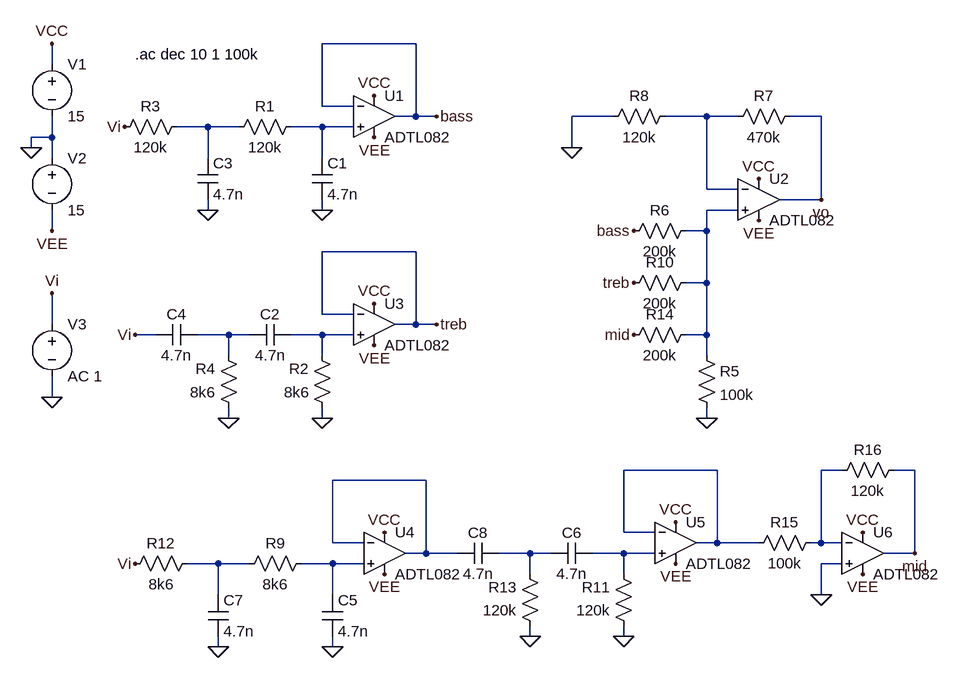
[diagram p0: schematic eq.asc]
eq.asc, the LTspice schematic file:
Version 4.1
SHEET 1 1384 1300
WIRE 448 32 304 32
WIRE -112 64 -112 32
WIRE 304 128 304 32
WIRE 352 128 304 128
WIRE 448 144 448 32
WIRE 448 144 416 144
WIRE 480 144 448 144
WIRE 752 144 688 144
WIRE 896 144 832 144
WIRE 944 144 896 144
WIRE 1072 144 1024 144
WIRE 128 160 80 160
WIRE 176 160 128 160
WIRE 304 160 256 160
WIRE 352 160 304 160
WIRE -112 176 -112 144
WIRE -112 176 -144 176
WIRE -144 192 -144 176
WIRE 688 192 688 144
WIRE -112 208 -112 176
WIRE 128 208 128 160
WIRE 304 208 304 160
WIRE 896 256 896 144
WIRE 944 256 896 256
WIRE 1072 272 1072 144
WIRE 1072 272 1008 272
WIRE 128 288 128 272
WIRE 304 288 304 272
WIRE 944 288 896 288
WIRE -112 320 -112 288
WIRE 896 320 896 288
WIRE 896 320 864 320
WIRE 448 352 304 352
WIRE 896 400 896 320
WIRE 896 400 864 400
WIRE 304 448 304 352
WIRE 352 448 304 448
WIRE -112 464 -112 416
WIRE 448 464 448 352
WIRE 448 464 416 464
WIRE 480 464 448 464
WIRE 48 480 16 480
WIRE 160 480 112 480
WIRE 192 480 160 480
WIRE 304 480 256 480
WIRE 352 480 304 480
WIRE 896 480 896 400
WIRE 896 480 864 480
WIRE 160 512 160 480
WIRE 304 512 304 480
WIRE 896 512 896 480
WIRE -112 576 -112 544
WIRE 160 608 160 592
WIRE 304 608 304 592
WIRE 896 608 896 592
WIRE 912 688 768 688
WIRE 1104 688 1072 688
WIRE 1216 688 1184 688
WIRE 464 704 320 704
WIRE 768 784 768 688
WIRE 816 784 768 784
WIRE 320 800 320 704
WIRE 368 800 320 800
WIRE 912 800 912 688
WIRE 912 800 880 800
WIRE 976 800 912 800
WIRE 1072 800 1072 688
WIRE 1072 800 1056 800
WIRE 1104 800 1072 800
WIRE 464 816 464 704
WIRE 464 816 432 816
WIRE 512 816 464 816
WIRE 624 816 576 816
WIRE 656 816 624 816
WIRE 768 816 720 816
WIRE 816 816 768 816
WIRE 1216 816 1216 688
WIRE 1216 816 1168 816
WIRE 144 832 96 832
WIRE 192 832 144 832
WIRE 320 832 272 832
WIRE 368 832 320 832
WIRE 1104 832 1072 832
WIRE 624 848 624 816
WIRE 768 848 768 816
WIRE 144 880 144 832
WIRE 320 880 320 832
WIRE 1072 880 1072 832
WIRE 624 944 624 928
WIRE 768 944 768 928
WIRE 144 960 144 944
WIRE 320 960 320 944
FLAG -112 320 VEE
FLAG 384 176 VEE
FLAG -112 32 VCC
FLAG 384 112 VCC
FLAG -144 192 0
FLAG -112 576 0
FLAG 480 144 bass
FLAG -112 416 Vi
FLAG 304 288 0
FLAG 0 160 Vi
FLAG 384 496 VEE
FLAG 384 432 VCC
FLAG 480 464 treb
FLAG 304 608 0
FLAG 16 480 Vi
FLAG 128 288 0
FLAG 160 608 0
FLAG 976 240 VCC
FLAG 976 304 VEE
FLAG 896 608 0
FLAG 784 320 bass
FLAG 784 400 treb
FLAG 1072 272 vo
FLAG 400 848 VEE
FLAG 400 784 VCC
FLAG 320 960 0
FLAG 16 832 Vi
FLAG 848 832 VEE
FLAG 848 768 VCC
FLAG 1216 816 mid
FLAG 768 944 0
FLAG 144 960 0
FLAG 624 944 0
FLAG 784 480 mid
FLAG 688 192 0
FLAG 1136 784 VCC
FLAG 1136 848 VEE
FLAG 1072 880 0
SYMBOL OpAmps\\ADTL082 384 80 R0
SYMATTR InstName U1
SYMBOL voltage -112 48 R0
WINDOW 123 0 0 Left 0
WINDOW 39 0 0 Left 0
SYMATTR InstName V1
SYMATTR Value 15
SYMBOL voltage -112 192 R0
WINDOW 123 0 0 Left 0
WINDOW 39 0 0 Left 0
SYMATTR InstName V2
SYMATTR Value 15
SYMBOL voltage -112 448 R0
WINDOW 123 0 0 Left 0
WINDOW 39 0 0 Left 0
SYMATTR InstName V3
SYMATTR Value AC 1
SYMBOL res 272 144 R90
WINDOW 0 0 56 VBottom 2
WINDOW 3 32 56 VTop 2
SYMATTR InstName R1
SYMATTR Value 120k
SYMBOL cap 288 208 R0
SYMATTR InstName C1
SYMATTR Value 4.7n
SYMBOL OpAmps\\ADTL082 384 400 R0
SYMATTR InstName U3
SYMBOL res 320 608 R180
WINDOW 0 36 76 Left 2
WINDOW 3 36 40 Left 2
SYMATTR InstName R2
SYMATTR Value 8k6
SYMBOL cap 256 464 R90
WINDOW 0 0 32 VBottom 2
WINDOW 3 32 32 VTop 2
SYMATTR InstName C2
SYMATTR Value 4.7n
SYMBOL res 96 144 R90
WINDOW 0 0 56 VBottom 2
WINDOW 3 32 56 VTop 2
SYMATTR InstName R3
SYMATTR Value 120k
SYMBOL cap 112 208 R0
SYMATTR InstName C3
SYMATTR Value 4.7n
SYMBOL res 176 608 R180
WINDOW 0 36 76 Left 2
WINDOW 3 36 40 Left 2
SYMATTR InstName R4
SYMATTR Value 8k6
SYMBOL cap 112 464 R90
WINDOW 0 0 32 VBottom 2
WINDOW 3 32 32 VTop 2
SYMATTR InstName C4
SYMATTR Value 4.7n
SYMBOL OpAmps\\ADTL082 976 208 R0
SYMATTR InstName U2
SYMBOL res 880 496 R0
SYMATTR InstName R5
SYMATTR Value 100k
SYMBOL res 880 304 R90
WINDOW 0 0 56 VBottom 2
WINDOW 3 32 56 VTop 2
SYMATTR InstName R6
SYMATTR Value 200k
SYMBOL res 880 384 R90
WINDOW 0 0 56 VBottom 2
WINDOW 3 32 56 VTop 2
SYMATTR InstName R10
SYMATTR Value 200k
SYMBOL OpAmps\\ADTL082 400 752 R0
SYMATTR InstName U4
SYMBOL res 288 816 R90
WINDOW 0 0 56 VBottom 2
WINDOW 3 32 56 VTop 2
SYMATTR InstName R9
SYMATTR Value 8k6
SYMBOL cap 304 880 R0
SYMATTR InstName C5
SYMATTR Value 4.7n
SYMBOL OpAmps\\ADTL082 848 736 R0
SYMATTR InstName U5
SYMBOL res 784 944 R180
WINDOW 0 36 76 Left 2
WINDOW 3 36 40 Left 2
SYMATTR InstName R11
SYMATTR Value 120k
SYMBOL cap 720 800 R90
WINDOW 0 0 32 VBottom 2
WINDOW 3 32 32 VTop 2
SYMATTR InstName C6
SYMATTR Value 4.7n
SYMBOL res 112 816 R90
WINDOW 0 0 56 VBottom 2
WINDOW 3 32 56 VTop 2
SYMATTR InstName R12
SYMATTR Value 8k6
SYMBOL cap 128 880 R0
SYMATTR InstName C7
SYMATTR Value 4.7n
SYMBOL res 640 944 R180
WINDOW 0 36 76 Left 2
WINDOW 3 36 40 Left 2
SYMATTR InstName R13
SYMATTR Value 120k
SYMBOL cap 576 800 R90
WINDOW 0 0 32 VBottom 2
WINDOW 3 32 32 VTop 2
SYMATTR InstName C8
SYMATTR Value 4.7n
SYMBOL res 880 464 R90
WINDOW 0 0 56 VBottom 2
WINDOW 3 32 56 VTop 2
SYMATTR InstName R14
SYMATTR Value 200k
SYMBOL res 1040 128 R90
WINDOW 0 0 56 VBottom 2
WINDOW 3 32 56 VTop 2
SYMATTR InstName R7
SYMATTR Value 470k
SYMBOL res 848 128 R90
WINDOW 0 0 56 VBottom 2
WINDOW 3 32 56 VTop 2
SYMATTR InstName R8
SYMATTR Value 120k
SYMBOL OpAmps\\ADTL082 1136 752 R0
SYMATTR InstName U6
SYMBOL res 1072 784 R90
WINDOW 0 0 56 VBottom 2
WINDOW 3 32 56 VTop 2
SYMATTR InstName R15
SYMATTR Value 100k
SYMBOL res 1200 672 R90
WINDOW 0 0 56 VBottom 2
WINDOW 3 32 56 VTop 2
SYMATTR InstName R16
SYMATTR Value 120k
TEXT 16 48 Left 2 !.ac dec 10 1 100k

The netlist it stands for:
* eq.asc
X§U1 N003 bass VCC VEE bass ADTL082  ; pins In+ In- V+ V- OUT
V1 VCC 0 15
V2 0 VEE 15
V3 Vi 0 AC 1
R1 N003 N002 120k
C1 N003 0 4.7n
X§U3 N006 treb VCC VEE treb ADTL082  ; pins In+ In- V+ V- OUT
R2 0 N006 8k6
C2 N006 N005 4.7n
R3 N002 Vi 120k
C3 N002 0 4.7n
R4 0 N005 8k6
C4 N005 Vi 4.7n
X§U2 N004 N001 VCC VEE vo ADTL082  ; pins In+ In- V+ V- OUT
R5 N004 0 100k
R6 N004 bass 200k
R10 N004 treb 200k
X§U4 N013 N009 VCC VEE N009 ADTL082  ; pins In+ In- V+ V- OUT
R9 N013 N012 8k6
C5 N013 0 4.7n
X§U5 N011 N007 VCC VEE N007 ADTL082  ; pins In+ In- V+ V- OUT
R11 0 N011 120k
C6 N011 N010 4.7n
R12 N012 Vi 8k6
C7 N012 0 4.7n
R13 0 N010 120k
C8 N010 N009 4.7n
R14 N004 mid 200k
R7 vo N001 470k
R8 N001 0 120k
X§U6 0 N008 VCC VEE mid ADTL082  ; pins In+ In- V+ V- OUT
R15 N008 N007 100k
R16 mid N008 120k
.ac dec 10 1 100k
.lib ADI.lib
.backanno
.end